# Altium project 机器人大赛硬件.PrjPcb (part 1 of 3)
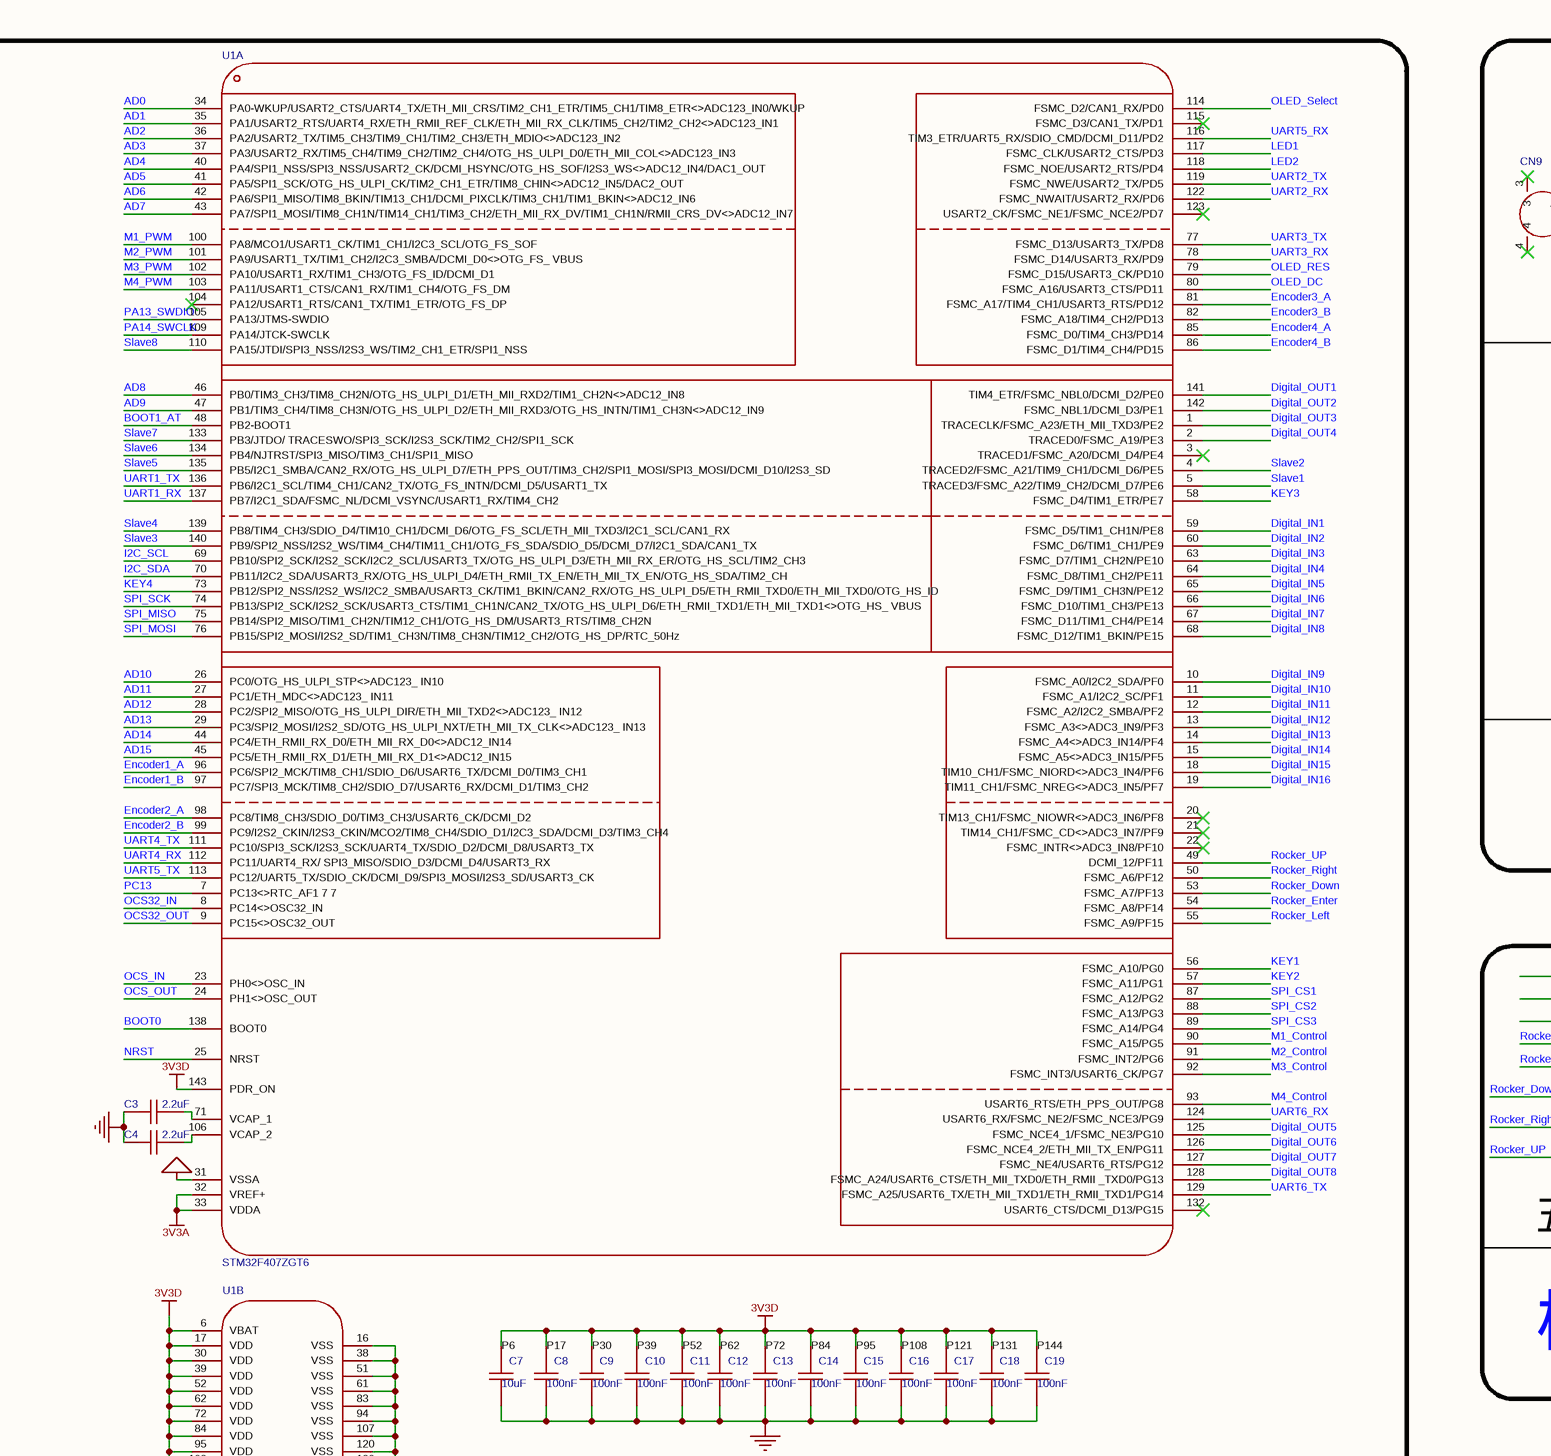
[diagram p0: P1.schdoc, top left]
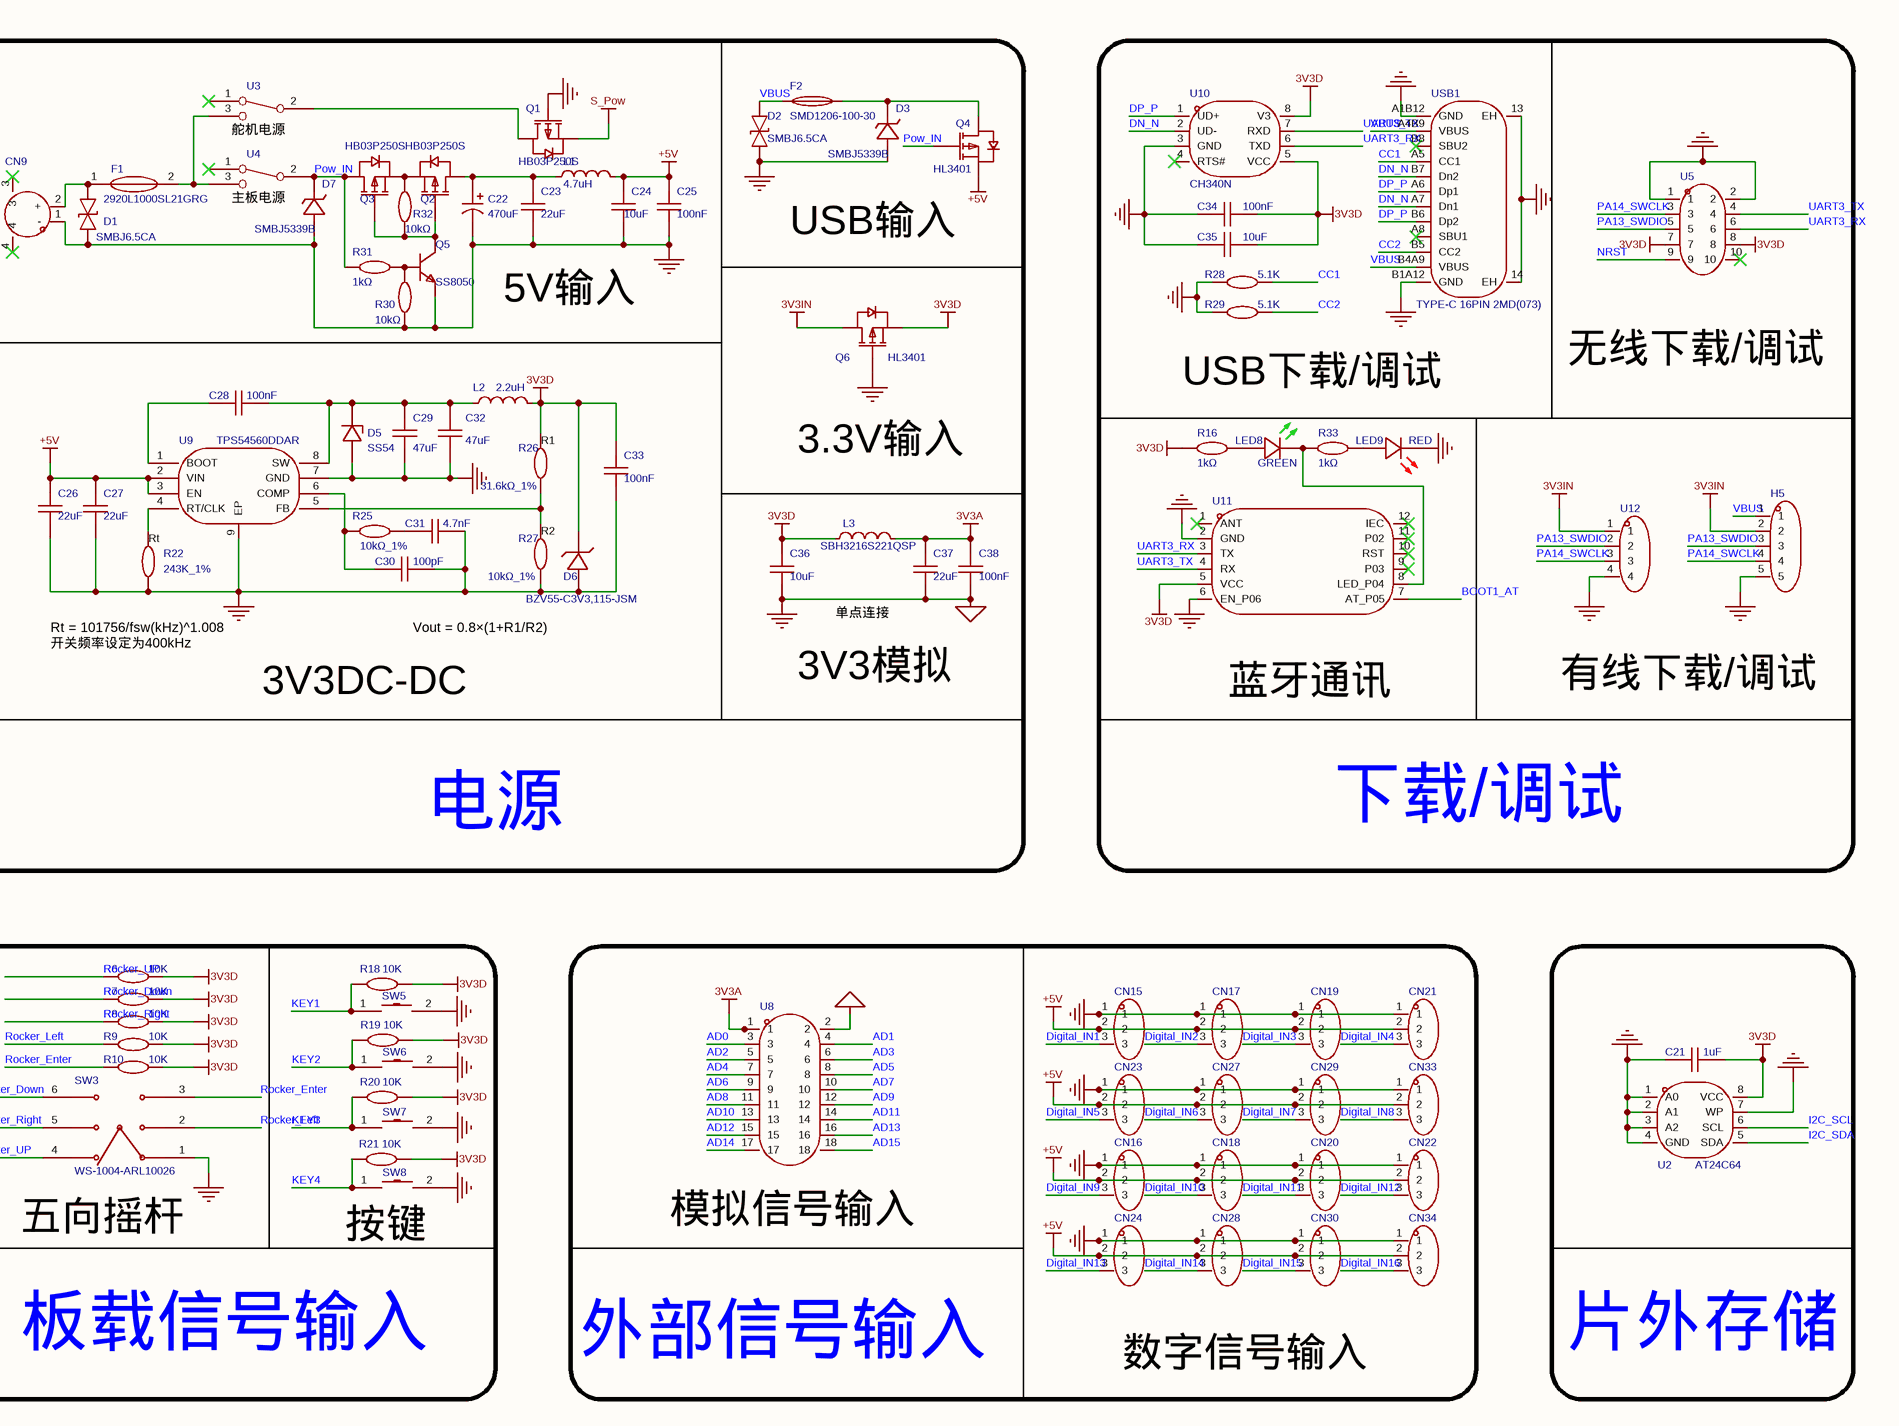
[diagram p1: P1.schdoc, top right]
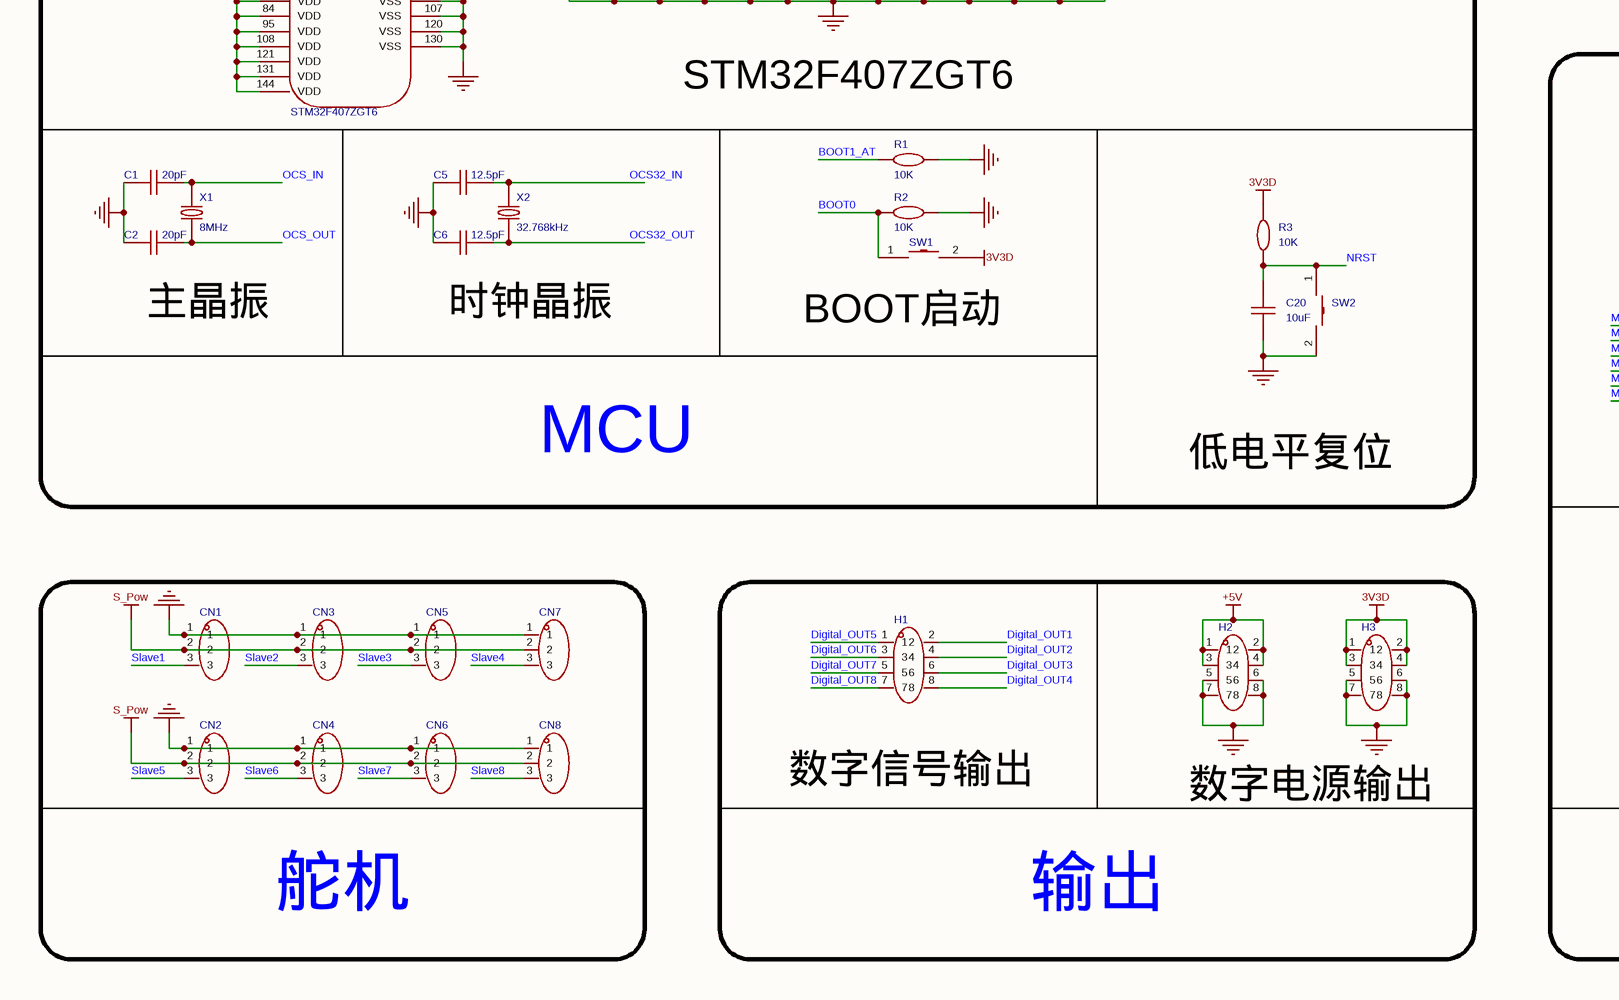
[diagram p2: P1.schdoc, bottom left]
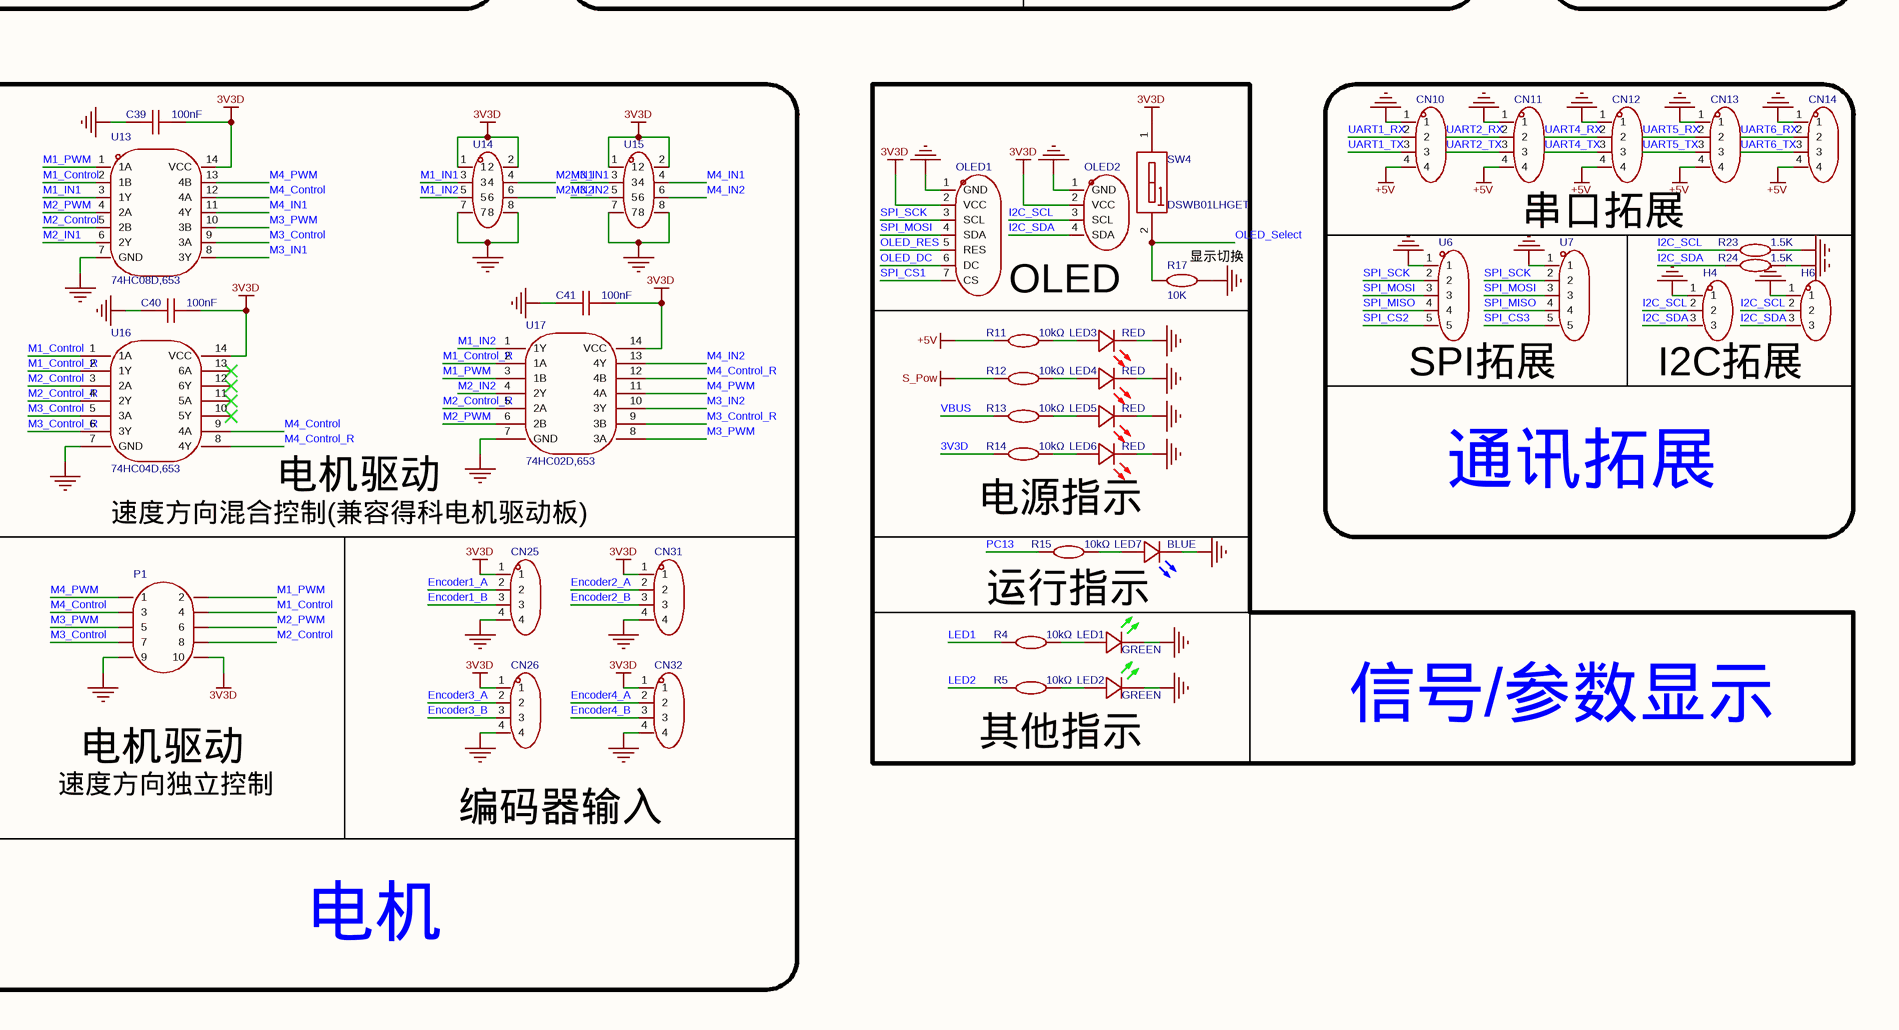
[diagram p3: P1.schdoc, bottom right]
1 sheet, 171 parts. Net scope: global (net labels, ports and power ports of the same name join across sheets).
Board file: PCB1.pcbdoc

## Sheet P1.schdoc
size 594 x 419 mm; Symbol: Sheet-Symbol_A2; Company: 开拓创新实验室; Drawed: Ideal_Fox; Version: V1.4; Page Size: A2; @Project Name: 机器人大赛硬件; @Page Count: 1; @Update Date: 2026-05-24; @Create Date: 2026-05-08; @Schematic Name: Schematic1; @Page No: 1; @Page Name: P1; Device: Sheet-Symbol_A2; Border: 1; Width: 2338; Height: 1652; Region Start: 1; X Region Count: 6; Y Region Count: 4; Blade Width: 10; Title Block Position: 3

### Parts
C1  20pF  [C0603]
C2  20pF  [C0603]
C3  2.2uF  [C0603]
C4  2.2uF  [C0603]
C5  12.5pF  [C0603]
C6  12.5pF  [C0603]
C7  10uF  [C0603]
C8  100nF  [C0603]
C9  100nF  [C0603]
C10  100nF  [C0603]
C11  100nF  [C0603]
C12  100nF  [C0603]
C13  100nF  [C0603]
C14  100nF  [C0603]
C15  100nF  [C0603]
C16  100nF  [C0603]
C17  100nF  [C0603]
C18  100nF  [C0603]
C19  100nF  [C0603]
C20  10uF  [C0603]
C21  1uF  [C0603]
C22  470uF  [CAP-SMD_BD6.3-L6.6-W6.6-LS7.3-FD-H7.7]
C23  22uF  [C0603]
C24  10uF  [C0603]
C25  100nF  [C0603]
C26  22uF  [C0603]
C27  22uF  [C0603]
C28  100nF  [C0603]
C29  47uF  [C0805]
C30  100pF  [C0603]
C31  4.7nF  [C0603]
C32  47uF  [C0805]
C33  100nF  [C0603]
C34  100nF  [C0603]
C35  10uF  [C0603]
C36  10uF  [C0603]
C37  22uF  [C0603]
C38  100nF  [C0603]
C39  100nF  [C0603]
C40  100nF  [C0603]
C41  100nF  [C0603]
CN1  ZX-XH2.54-3PZZ  [CONN-TH_3P-P2.54_2501S-3P]  (value not drawn)
CN2  ZX-XH2.54-3PZZ  [CONN-TH_3P-P2.54_2501S-3P]  (value not drawn)
CN3  ZX-XH2.54-3PZZ  [CONN-TH_3P-P2.54_2501S-3P]  (value not drawn)
CN4  ZX-XH2.54-3PZZ  [CONN-TH_3P-P2.54_2501S-3P]  (value not drawn)
CN5  ZX-XH2.54-3PZZ  [CONN-TH_3P-P2.54_2501S-3P]  (value not drawn)
CN6  ZX-XH2.54-3PZZ  [CONN-TH_3P-P2.54_2501S-3P]  (value not drawn)
CN7  ZX-XH2.54-3PZZ  [CONN-TH_3P-P2.54_2501S-3P]  (value not drawn)
CN8  ZX-XH2.54-3PZZ  [CONN-TH_3P-P2.54_2501S-3P]  (value not drawn)
CN9  XT60PW-M  [CONN-TH_XT60PW-M]  (value not drawn)
CN10  ZX-XH2.54-4PZZ  [CONN-TH_4P-P2.50_4PIN]  (value not drawn)
CN11  ZX-XH2.54-4PZZ  [CONN-TH_4P-P2.50_4PIN]  (value not drawn)
CN12  ZX-XH2.54-4PZZ  [CONN-TH_4P-P2.50_4PIN]  (value not drawn)
CN13  ZX-XH2.54-4PZZ  [CONN-TH_4P-P2.50_4PIN]  (value not drawn)
CN14  ZX-XH2.54-4PZZ  [CONN-TH_4P-P2.50_4PIN]  (value not drawn)
CN15  HX-XH2.54-3PZZ  [CONN-TH_3P-P2.50_HC-XH-3A-G]  (value not drawn)
CN16  HX-XH2.54-3PZZ  [CONN-TH_3P-P2.50_HC-XH-3A-G]  (value not drawn)
CN17  HX-XH2.54-3PZZ  [CONN-TH_3P-P2.50_HC-XH-3A-G]  (value not drawn)
CN18  HX-XH2.54-3PZZ  [CONN-TH_3P-P2.50_HC-XH-3A-G]  (value not drawn)
CN19  HX-XH2.54-3PZZ  [CONN-TH_3P-P2.50_HC-XH-3A-G]  (value not drawn)
CN20  HX-XH2.54-3PZZ  [CONN-TH_3P-P2.50_HC-XH-3A-G]  (value not drawn)
CN21  HX-XH2.54-3PZZ  [CONN-TH_3P-P2.50_HC-XH-3A-G]  (value not drawn)
CN22  HX-XH2.54-3PZZ  [CONN-TH_3P-P2.50_HC-XH-3A-G]  (value not drawn)
CN23  HX-XH2.54-3PZZ  [CONN-TH_3P-P2.50_HC-XH-3A-G]  (value not drawn)
CN24  HX-XH2.54-3PZZ  [CONN-TH_3P-P2.50_HC-XH-3A-G]  (value not drawn)
CN25  HX-XH2.54-4PZZ  [CONN-TH_4P-P2.50-XH2.54-4P]  (value not drawn)
CN26  HX-XH2.54-4PZZ  [CONN-TH_4P-P2.50-XH2.54-4P]  (value not drawn)
CN27  HX-XH2.54-3PZZ  [CONN-TH_3P-P2.50_HC-XH-3A-G]  (value not drawn)
CN28  HX-XH2.54-3PZZ  [CONN-TH_3P-P2.50_HC-XH-3A-G]  (value not drawn)
CN29  HX-XH2.54-3PZZ  [CONN-TH_3P-P2.50_HC-XH-3A-G]  (value not drawn)
CN30  HX-XH2.54-3PZZ  [CONN-TH_3P-P2.50_HC-XH-3A-G]  (value not drawn)
CN31  HX-XH2.54-4PZZ  [CONN-TH_4P-P2.50-XH2.54-4P]  (value not drawn)
CN32  HX-XH2.54-4PZZ  [CONN-TH_4P-P2.50-XH2.54-4P]  (value not drawn)
CN33  HX-XH2.54-3PZZ  [CONN-TH_3P-P2.50_HC-XH-3A-G]  (value not drawn)
CN34  HX-XH2.54-3PZZ  [CONN-TH_3P-P2.50_HC-XH-3A-G]  (value not drawn)
D1  SMBJ6.5CA  [SMB_L4.6-W3.5-LS5.3-BI]
D2  SMBJ6.5CA  [SMB_L4.6-W3.5-LS5.3-BI]
D3  SMBJ5339B  [SMB_L4.6-W3.6-LS5.4-RD]
D5  SS54  [SMA_L4.3-W2.6-LS5.0-FD]
D6  BZV55-C3V3,115-JSM  [SOD-80_L3.5-W1.5-RD]
D7  SMBJ5339B  [SMB_L4.6-W3.6-LS5.4-RD]
F1  2920L1000SL21GRG  [FUSE-SMD_L8.0-W5.5]
F2  SMD1206-100-30  [F1206]
H1  PZ254V-12-8P  [HDR-TH_8P-P2.54-V-M-R2-C4-S2.54]  (value not drawn)
H2  PZ254V-12-8P  [HDR-TH_8P-P2.54-V-M-R2-C4-S2.54]  (value not drawn)
H3  PZ254V-12-8P  [HDR-TH_8P-P2.54-V-M-R2-C4-S2.54]  (value not drawn)
H4  12251103CNG0S115001  [HDR-TH_3P-P2.54-V-M-1]  (value not drawn)
H5  PZ254-1-05-W-8.5  [HDR-TH_5P-P2.54-H-M-W10.4-N]  (value not drawn)
H6  12251103CNG0S115001  [HDR-TH_3P-P2.54-V-M-1]  (value not drawn)
L1  4.7uH  [IND-SMD_L4.6-W4.1-A]
L2  2.2uH  [IND-SMD_L4.6-W4.1_MHCI04015]
L3  SBH3216S221QSP  [L1206]
LED1  GREEN  [LED0805-FD_GL0805UG01]
LED2  GREEN  [LED0805-FD_GL0805UG01]
LED3  RED  [LED0805-R-RD_RED]
LED4  RED  [LED0805-R-RD_RED]
LED5  RED  [LED0805-R-RD_RED]
LED6  RED  [LED0805-R-RD_RED]
LED7  BLUE  [LED0805-RD_BLUE]
LED8  GREEN  [LED0805-FD_GL0805UG01]
LED9  RED  [LED0805-R-RD_RED]
OLED1  HS96L01W4S03  [OLED-TH_HS96L01W4S03]  (value not drawn)
OLED2  HS96L03W2C03  [OLED-TH_L27.8-W27.2-P2.54_C9900033791]  (value not drawn)
P1  2.54-2*5P简牛  [IDC-TH_10P-P2.54_C5665]  (value not drawn)
Q1  HB03P250S  [TO-252-2_L6.6-W6.1-P4.60-LS10.0-BR-CW]
Q2  HB03P250S  [TO-252-2_L6.6-W6.1-P4.60-LS10.0-BR-CW]
Q3  HB03P250S  [TO-252-2_L6.6-W6.1-P4.60-LS10.0-BR-CW]
Q4  HL3401  [SOT-23-3_L3.0-W1.7-P0.95-LS2.9-BR]
Q5  SS8050  [SOT-23-3_L2.9-W1.3-P1.90-LS2.4-BR]
Q6  HL3401  [SOT-23-3_L3.0-W1.7-P0.95-LS2.9-BR]
R1  10K  [R0603]
R2  10K  [R0603]
R3  10K  [R0603]
R4  10kΩ  [R0603]
R5  10kΩ  [R0603]
R6  10K  [R0603]
R7  10K  [R0603]
R8  10K  [R0603]
R9  10K  [R0603]
R10  10K  [R0603]
R11  10kΩ  [R0603]
R12  10kΩ  [R0603]
R13  10kΩ  [R0603]
R14  10kΩ  [R0603]
R15  10kΩ  [R0603]
R16  1kΩ  [R0603]
R17  10K  [R0603]
R18  10K  [R0603]
R19  10K  [R0603]
R20  10K  [R0603]
R21  10K  [R0603]
R22  243K_1%  [R0603]
R23  1.5K  [R0603]
R24  1.5K  [R0603]
R25  10kΩ_1%  [R0603]
R26  31.6kΩ_1%  [R0603]
R27  10kΩ_1%  [R0603]
R28  5.1K  [R0603]
R29  5.1K  [R0603]
R30  10kΩ  [R0603]
R31  1kΩ  [R0603]
R32  10kΩ  [R0603]
R33  1kΩ  [R0603]
SW1  TS-1101-C-W  [SW-SMD_L6.0-W3.3-LS8.0_TS-1101-C-W]  (value not drawn)
SW2  TS-1101-C-W  [SW-SMD_L6.0-W3.3-LS8.0_TS-1101-C-W]  (value not drawn)
SW3  WS-1004-ARL10026  [SW-TH_WS-1004-ARL10026]
SW4  DSWB01LHGET  [SW-TH_DSWB01LHGET]
SW5  TS-1101-C-W  [SW-SMD_L6.0-W3.3-LS8.0_TS-1101-C-W]  (value not drawn)
SW6  TS-1101-C-W  [SW-SMD_L6.0-W3.3-LS8.0_TS-1101-C-W]  (value not drawn)
SW7  TS-1101-C-W  [SW-SMD_L6.0-W3.3-LS8.0_TS-1101-C-W]  (value not drawn)
SW8  TS-1101-C-W  [SW-SMD_L6.0-W3.3-LS8.0_TS-1101-C-W]  (value not drawn)
U1  STM32F407ZGT6  [LQFP-144_L20.0-W20.0-P0.50-LS22.0-BL]  (parts A,B of 2)
U2  AT24C64  [SOP-8_L4.9-W3.9-P1.27-LS6.0-BL]
U3  MT-0-102-A101-M200-RS  [SW-TH_MT-0-103-A101-M200-RS]  (value not drawn)
U4  MT-0-102-A101-M200-RS  [SW-TH_MT-0-103-A101-M200-RS]  (value not drawn)
U5  2.54-2*5  [HDR-TH_10P-P2.54-V-F-R2-C5-S2.54]  (value not drawn)
U6  MTP125-1105S1  [HDR-TH_5P-P2.54-V-M]  (value not drawn)
U7  MTP125-1105S1  [HDR-TH_5P-P2.54-V-M]  (value not drawn)
U8  XDFH-0254-2*9P  [CONN-TH_18P-P2.54_LX_XDFH-0254-2X9P]  (value not drawn)
U9  TPS54560DDAR  [SOIC-8_L5.0-W4.0-P1.27-LS6.0-BL-EP2.0]
U10  CH340N  [SOP-8_L4.9-W3.9-P1.27-LS6.0-BL]
U11  (no value)  [BULETM-SMD_RF-BM-4044B2]
U12  B4B-XH-A(LF)(SN)  [CONN-TH_B4B-XH-A-LF-SN]  (value not drawn)
U13  74HC08D,653  [SOIC-14_L8.7-W3.9-P1.27-LS6.0-BL]
U14  XDFH-0254-2*4P  [CONN-TH_8P-P2.54_LX_XDFH-0254-2X4P]  (value not drawn)
U15  XDFH-0254-2*4P  [CONN-TH_8P-P2.54_LX_XDFH-0254-2X4P]  (value not drawn)
U16  74HC04D,653  [SOIC-14_L8.7-W3.9-P1.27-LS6.0-BL]
U17  74HC02D,653  [SOIC-14_L8.7-W3.9-P1.27-LS6.0-BL]
USB1  TYPE-C 16PIN 2MD(073)  [USB-C-SMD_TYPE-C-16PIN-2MD-073]
X1  8MHz  [CRYSTAL-TH_L11.1-W4.7-P4.88]
X2  32.768kHz  [FC-135R_L3.2-W1.5]

### Blocks framed on the sheet
MCU: C1-C20 R1-R3 SW1 SW2 U1 X1 X2
电源: C22-C33 C36-C38 CN9 D1-D3 D5-D7 F1 F2 L1-L3 Q1-Q6 R22 R25-R27 R30-R32 U3 U4 U9
下载/调试: C34 C35 H5 LED8 LED9 R16 R28 R29 R33 U5 U10-U12 USB1
板载信号输入: R6-R10 R18-R21 SW3 SW5-SW8
外部信号输入: CN15-CN24 CN27-CN30 CN33 CN34 U8
片外存储: C21 U2
电机: C39-C41 CN25 CN26 CN31 CN32 P1 U13-U17
信号/参数显示: LED1-LED7 OLED1 OLED2 R4 R5 R11-R15 R17 SW4
通讯拓展: CN10-CN14 H4 H6 R23 R24 U6 U7
舵机: CN1-CN8
输出: H1-H3

### Nets
3V3A: C37.2 C38.2 L3.2 U1.32(VREF+) U1.33(VDDA) U8.1
3V3D: C7.2 C8.2 C9.2 C10.2 C11.2 C12.2 C13.2 C14.2 C15.2 C16.2 C17.2 C18.2 C19.2 C21.1 C33.2 C34.1 C35.1 C36.2 C39.1 C40.1 C41.1 CN25.1 CN26.1 CN31.1 CN32.1 D6.1(K) H3.1 H3.2 H3.3 H3.4 L2.2 L3.1 OLED1.2(VCC) OLED2.2(VCC) P1.10 Q6.2(S) R3.2 R6.2 R7.2 R8.2 R9.2 R10.2 R14.2 R16.2 R18.2 R19.2 R20.2 R21.2 R26.2 SW1.2 SW4.1(A1) U1.6(VBAT) U1.17(VDD) U1.30(VDD) U1.39(VDD) U1.52(VDD) U1.62(VDD) U1.72(VDD) U1.84(VDD) U1.95(VDD) U1.108(VDD) U1.121(VDD) U1.131(VDD) U1.143(PDR_ON) U1.144(VDD) U2.8(VCC) U5.7 U5.8 U10.5(VCC) U10.8(V3) U11.5(VCC) U13.14(VCC) U14.1 U14.2 U15.1 U15.2 U16.14(VCC) U17.14(VCC)
3V3IN: H5.2 Q6.3(D) U12.1
+5V: C24.2 C25.2 C26.2 C27.2 CN10.4 CN11.4 CN12.4 CN13.4 CN14.4 CN15.2 CN16.2 CN17.2 CN18.2 CN19.2 CN20.2 CN21.2 CN22.2 CN23.2 CN24.2 CN27.2 CN28.2 CN29.2 CN30.2 CN33.2 CN34.2 H2.1 H2.2 H2.3 H2.4 L1.2 Q4.2(S) R11.2 U9.2(VIN) U9.3(EN)
AGND: C1.1 C2.1 C3.2 C4.2 C5.1 C6.1 C7.1 C8.1 C9.1 C10.1 C11.1 C12.1 C13.1 C14.1 C15.1 C16.1 C17.1 C18.1 C19.1 C20.1 C21.2 C22.2 C23.1 C24.1 C25.1 C26.1 C27.1 C29.1 C30.1 C31.1 C32.1 C33.1 C34.2 C35.2 C36.1 C37.1 C38.1 C39.2 C40.2 C41.2 CN1.1 CN2.1 CN3.1 CN4.1 CN5.1 CN6.1 CN7.1 CN8.1 CN9.1(-) CN10.1 CN11.1 CN12.1 CN13.1 CN14.1 CN15.1 CN16.1 CN17.1 CN18.1 CN19.1 CN20.1 CN21.1 CN22.1 CN23.1 CN24.1 CN25.4 CN26.4 CN27.1 CN28.1 CN29.1 CN30.1 CN31.4 CN32.4 CN33.1 CN34.1 D1.2 D2.2 D3.2(A) D5.1(A) D6.2(A) D7.2(A) H2.5 H2.6 H2.7 H2.8 H3.5 H3.6 H3.7 H3.8 H4.1 H5.5 H6.1 LED1.2(C) LED2.2(C) LED3.2(C) LED4.2(C) LED5.2(C) LED6.2(C) LED7.1(K) LED9.2(C) OLED1.1(GND) OLED2.1(GND) P1.9 Q1.1(G) Q5.2(E) Q6.1(G) R1.2 R2.2 R17.1 R22.2 R23.2 R24.2 R27.1 R28.2 R29.2 R30.1 SW2.2 SW3.1 SW5.2 SW6.2 SW7.2 SW8.2 U1.16(VSS) U1.31(VSSA) U1.38(VSS) U1.51(VSS) U1.61(VSS) U1.83(VSS) U1.94(VSS) U1.107(VSS) U1.120(VSS) U1.130(VSS) U2.1(A0) U2.2(A1) U2.3(A2) U2.4(GND) U2.7(WP) U5.1 U5.2 U6.1 U7.1 U8.2 U9.7(GND) U9.9(EP) U10.3(GND) U11.2(GND) U11.6(EN_P06) U12.4 U13.7(GND) U14.7 U14.8 U15.7 U15.8 U16.7(GND) U17.7(GND) USB1.13(EH) USB1.14(EH) USB1.A1B12(GND) USB1.B1A12(GND)  [also labelled GND]
S_Pow: CN1.2 CN2.2 CN3.2 CN4.2 CN5.2 CN6.2 CN7.2 CN8.2 Q1.3(S) R12.2
AD0: U1.34(PA0-WKUP/USART2_CTS/UART4_TX/ETH_MII_CRS/TIM2_CH1_ETR/TIM5_CH1/TIM8_ETR<>ADC123_IN0/WKUP) U8.3
AD1: U1.35(PA1/USART2_RTS/UART4_RX/ETH_RMII_REF_CLK/ETH_MII_RX_CLK/TIM5_CH2/TIM2_CH2<>ADC123_IN1) U8.4
AD2: U1.36(PA2/USART2_TX/TIM5_CH3/TIM9_CH1/TIM2_CH3/ETH_MDIO<>ADC123_IN2) U8.5
AD3: U1.37(PA3/USART2_RX/TIM5_CH4/TIM9_CH2/TIM2_CH4/OTG_HS_ULPI_D0/ETH_MII_COL<>ADC123_IN3) U8.6
AD4: U1.40(PA4/SPI1_NSS/SPI3_NSS/USART2_CK/DCMI_HSYNC/OTG_HS_SOF/I2S3_WS<>ADC12_IN4/DAC1_OUT) U8.7
AD5: U1.41(PA5/SPI1_SCK/OTG_HS_ULPI_CK/TIM2_CH1_ETR/TIM8_CHIN<>ADC12_IN5/DAC2_OUT) U8.8
AD6: U1.42(PA6/SPI1_MISO/TIM8_BKIN/TIM13_CH1/DCMI_PIXCLK/TIM3_CH1/TIM1_BKIN<>ADC12_IN6) U8.9
AD7: U1.43(PA7/SPI1_MOSI/TIM8_CH1N/TIM14_CH1/TIM3_CH2/ETH_MII_RX_DV/TIM1_CH1N/RMII_CRS_DV<>ADC12_IN7) U8.10
AD8: U1.46(PB0/TIM3_CH3/TIM8_CH2N/OTG_HS_ULPI_D1/ETH_MII_RXD2/TIM1_CH2N<>ADC12_IN8) U8.11
AD9: U1.47(PB1/TIM3_CH4/TIM8_CH3N/OTG_HS_ULPI_D2/ETH_MII_RXD3/OTG_HS_INTN/TIM1_CH3N<>ADC12_IN9) U8.12
AD10: U1.26(PC0/OTG_HS_ULPI_STP<>ADC123__IN10) U8.13
AD11: U1.27(PC1/ETH_MDC<>ADC123__IN11) U8.14
AD12: U1.28(PC2/SPI2_MISO/OTG_HS_ULPI_DIR/ETH_MII_TXD2<>ADC123__IN12) U8.15
AD13: U1.29(PC3/SPI2_MOSI/I2S2_SD/OTG_HS_ULPI_NXT/ETH_MII_TX_CLK<>ADC123__IN13) U8.16
AD14: U1.44(PC4/ETH_RMII_RX_D0/ETH_MII_RX_D0<>ADC12_IN14) U8.17
AD15: U1.45(PC5/ETH_RMII_RX_D1/ETH_MII_RX_D1<>ADC12_IN15) U8.18
BOOT0: R2.1 SW1.1 U1.138(BOOT0)
BOOT1_AT: R1.1 U1.48(PB2-BOOT1) U11.7(AT_P05)
CC1: R28.1 USB1.A5(CC1)
CC2: R29.1 USB1.B5(CC2)
Digital_IN1: CN15.3 U1.59(FSMC_D5/TIM1_CH1N/PE8)
Digital_IN2: CN17.3 U1.60(FSMC_D6/TIM1_CH1/PE9)
Digital_IN3: CN19.3 U1.63(FSMC_D7/TIM1_CH2N/PE10)
Digital_IN4: CN21.3 U1.64(FSMC_D8/TIM1_CH2/PE11)
Digital_IN5: CN23.3 U1.65(FSMC_D9/TIM1_CH3N/PE12)
Digital_IN6: CN27.3 U1.66(FSMC_D10/TIM1_CH3/PE13)
Digital_IN7: CN29.3 U1.67(FSMC_D11/TIM1_CH4/PE14)
Digital_IN8: CN33.3 U1.68(FSMC_D12/TIM1_BKIN/PE15)
Digital_IN9: CN16.3 U1.10(FSMC_A0/I2C2_SDA/PF0)
Digital_IN10: CN18.3 U1.11(FSMC_A1/I2C2_SC/PF1)
Digital_IN11: CN20.3 U1.12(FSMC_A2/I2C2_SMBA/PF2)
Digital_IN12: CN22.3 U1.13(FSMC_A3<>ADC3_IN9/PF3)
Digital_IN13: CN24.3 U1.14(FSMC_A4<>ADC3_IN14/PF4)
Digital_IN14: CN28.3 U1.15(FSMC_A5<>ADC3_IN15/PF5)
Digital_IN15: CN30.3 U1.18(TIM10_CH1/FSMC_NIORD<>ADC3_IN4/PF6)
Digital_IN16: CN34.3 U1.19(TIM11_CH1/FSMC_NREG<>ADC3_IN5/PF7)
Digital_OUT1: H1.2 U1.141(TIM4_ETR/FSMC_NBL0/DCMI_D2/PE0)
Digital_OUT2: H1.4 U1.142(FSMC_NBL1/DCMI_D3/PE1)
Digital_OUT3: H1.6 U1.1(TRACECLK/FSMC_A23/ETH_MII_TXD3/PE2)
Digital_OUT4: H1.8 U1.2(TRACED0/FSMC_A19/PE3)
Digital_OUT5: H1.1 U1.125(FSMC_NCE4_1/FSMC_NE3/PG10)
Digital_OUT6: H1.3 U1.126(FSMC_NCE4_2/ETH_MII_TX_EN/PG11)
Digital_OUT7: H1.5 U1.127(FSMC_NE4/USART6_RTS/PG12)
Digital_OUT8: H1.7 U1.128(FSMC_A24/USART6_CTS/ETH_MII_TXD0/ETH_RMII__TXD0/PG13)
DN_N: U10.2(UD-) USB1.A7(Dn1) USB1.B7(Dn2)
DP_P: U10.1(UD+) USB1.A6(Dp1) USB1.B6(Dp2)
Encoder1_A: CN25.2 U1.96(PC6/SPI2_MCK/TIM8_CH1/SDIO_D6/USART6_TX/DCMI_D0/TIM3_CH1)
Encoder1_B: CN25.3 U1.97(PC7/SPI3_MCK/TIM8_CH2/SDIO_D7/USART6_RX/DCMI_D1/TIM3_CH2)
Encoder2_A: CN31.2 U1.98(PC8/TIM8_CH3/SDIO_D0/TIM3_CH3/USART6_CK/DCMI_D2)
Encoder2_B: CN31.3 U1.99(PC9/I2S2_CKIN/I2S3_CKIN/MCO2/TIM8_CH4/SDIO_D1/I2C3_SDA/DCMI_D3/TIM3_CH4)
Encoder3_A: CN26.2 U1.81(FSMC_A17/TIM4_CH1/USART3_RTS/PD12)
Encoder3_B: CN26.3 U1.82(FSMC_A18/TIM4_CH2/PD13)
Encoder4_A: CN32.2 U1.85(FSMC_D0/TIM4_CH3/PD14)
Encoder4_B: CN32.3 U1.86(FSMC_D1/TIM4_CH4/PD15)
I2C_SCL: H4.2 H6.2 OLED2.3(SCL) R23.1 U1.69(PB10/SPI2_SCK/I2S2_SCK/I2C2_SCL/USART3_TX/OTG_HS_ULPI_D3/ETH_MII_RX_ER/OTG_HS_SCL/TIM2_CH3) U2.6(SCL)
I2C_SDA: H4.3 H6.3 OLED2.4(SDA) R24.1 U1.70(PB11/I2C2_SDA/USART3_RX/OTG_HS_ULPI_D4/ETH_RMII_TX_EN/ETH_MII_TX_EN/OTG_HS_SDA/TIM2_CH) U2.5(SDA)
KEY1: R18.1 SW5.1 U1.56(FSMC_A10/PG0)
KEY2: R19.1 SW6.1 U1.57(FSMC_A11/PG1)
KEY3: R20.1 SW7.1 U1.58(FSMC_D4/TIM1_ETR/PE7)
KEY4: R21.1 SW8.1 U1.73(PB12/SPI2_NSS/I2S2_WS/I2C2_SMBA/USART3_CK/TIM1_BKIN/CAN2_RX/OTG_HS_ULPI_D5/ETH_RMII_TXD0/ETH_MII_TXD0/OTG_HS_ID)
LED1: R4.2 U1.117(FSMC_CLK/USART2_CTS/PD3)
LED2: R5.2 U1.118(FSMC_NOE/USART2_RTS/PD4)
M1_Control: P1.4 U1.90(FSMC_A15/PG5) U13.2(1B) U16.1(1A)
M1_Control_R: U16.2(1Y) U17.2(1A)
M1_IN1: U13.3(1Y) U14.3
M1_IN2: U14.5 U17.1(1Y)
M1_PWM: P1.2 U1.100(PA8/MCO1/USART1_CK/TIM1_CH1/I2C3_SCL/OTG_FS_SOF) U13.1(1A) U17.3(1B)
M2_Control: P1.8 U1.91(FSMC_INT2/PG6) U13.5(2B) U16.3(2A)
M2_Control_R: U16.4(2Y) U17.5(2A)
M2_IN1: U13.6(2Y) U14.4
M2_IN2: U14.6 U17.4(2Y)
M2_PWM: P1.6 U1.101(PA9/USART1_TX/TIM1_CH2/I2C3_SMBA/DCMI_D0<>OTG_FS__VBUS) U13.4(2A) U17.6(2B)
M3_Control: P1.7 U1.92(FSMC_INT3/USART6_CK/PG7) U13.9(3A) U16.5(3A)
M3_Control_R: U16.6(3Y) U17.9(3B)
M3_IN1: U13.8(3Y) U15.3
M3_IN2: U15.5 U17.10(3Y)
M3_PWM: P1.5 U1.102(PA10/USART1_RX/TIM1_CH3/OTG_FS_ID/DCMI_D1) U13.10(3B) U17.8(3A)
M4_Control: P1.3 U1.93(USART6_RTS/ETH_PPS_OUT/PG8) U13.12(4A) U16.9(4A)
M4_Control_R: U16.8(4Y) U17.12(4B)
M4_IN1: U13.11(4Y) U15.4
M4_IN2: U15.6 U17.13(4Y)
M4_PWM: P1.1 U1.103(PA11/USART1_CTS/CAN1_RX/TIM1_CH4/OTG_FS_DM) U13.13(4B) U17.11(4A)
NRST: C20.2 R3.1 SW2.1 U1.25(NRST) U5.9
OCS32_IN: C5.2 U1.8(PC14<>OSC32_IN) X2.2
OCS32_OUT: C6.2 U1.9(PC15<>OSC32_OUT) X2.1
OCS_IN: C1.2 U1.23(PH0<>OSC_IN) X1.2
OCS_OUT: C2.2 U1.24(PH1<>OSC_OUT) X1.1
OLED_DC: OLED1.6(DC) U1.80(FSMC_A16/USART3_CTS/PD11)
OLED_RES: OLED1.5(RES) U1.79(FSMC_D15/USART3_CK/PD10)
OLED_Select: R17.2 SW4.2 U1.114(FSMC_D2/CAN1_RX/PD0)
PA13_SWDIO: H5.3 U1.105(PA13/JTMS-SWDIO) U5.5 U12.2
PA14_SWCLK: H5.4 U1.109(PA14/JTCK-SWCLK) U5.3 U12.3
PC13: R15.2 U1.7(PC13<>RTC_AF1_7_7)
Pow_IN: D7.1(K) Q3.2(D) Q4.1(G) R31.2 U4.2
Rocker_Down: R7.1 SW3.6 U1.53(FSMC_A7/PF13)
Rocker_Enter: R10.1 SW3.3 U1.54(FSMC_A8/PF14)
Rocker_Left: R9.1 SW3.2 U1.55(FSMC_A9/PF15)
Rocker_Right: R8.1 SW3.5 U1.50(FSMC_A6/PF12)
Rocker_UP: R6.1 SW3.4 U1.49(DCMI_12/PF11)
Slave1: CN1.3 U1.5(TRACED3/FSMC_A22/TIM9_CH2/DCMI_D7/PE6)
Slave2: CN3.3 U1.4(TRACED2/FSMC_A21/TIM9_CH1/DCMI_D6/PE5)
Slave3: CN5.3 U1.140(PB9/SPI2_NSS/I2S2_WS/TIM4_CH4/TIM11_CH1/OTG_FS_SDA/SDIO_D5/DCMI_D7/I2C1_SDA/CAN1_TX)
Slave4: CN7.3 U1.139(PB8/TIM4_CH3/SDIO_D4/TIM10_CH1/DCMI_D6/OTG_FS_SCL/ETH_MII_TXD3/I2C1_SCL/CAN1_RX)
Slave5: CN2.3 U1.135(PB5/I2C1_SMBA/CAN2_RX/OTG_HS_ULPI_D7/ETH_PPS_OUT/TIM3_CH2/SPI1_MOSI/SPI3_MOSI/DCMI_D10/I2S3_SD)
Slave6: CN4.3 U1.134(PB4/NJTRST/SPI3_MISO/TIM3_CH1/SPI1_MISO)
Slave7: CN6.3 U1.133(PB3/JTDO/_TRACESWO/SPI3_SCK/I2S3_SCK/TIM2_CH2/SPI1_SCK)
Slave8: CN8.3 U1.110(PA15/JTDI/SPI3_NSS/I2S3_WS/TIM2_CH1_ETR/SPI1_NSS)
SPI_CS1: OLED1.7(CS) U1.87(FSMC_A12/PG2)
SPI_CS2: U1.88(FSMC_A13/PG3) U6.5
SPI_CS3: U1.89(FSMC_A14/PG4) U7.5
SPI_MISO: U1.75(PB14/SPI2_MISO/TIM1_CH2N/TIM12_CH1/OTG_HS_DM/USART3_RTS/TIM8_CH2N) U6.4 U7.4
SPI_MOSI: OLED1.4(SDA) U1.76(PB15/SPI2_MOSI/I2S2_SD/TIM1_CH3N/TIM8_CH3N/TIM12_CH2/OTG_HS_DP/RTC_50Hz) U6.3 U7.3
SPI_SCK: OLED1.3(SCL) U1.74(PB13/SPI2_SCK/I2S2_SCK/USART3_CTS/TIM1_CH1N/CAN2_TX/OTG_HS_ULPI_D6/ETH_RMII_TXD1/ETH_MII_TXD1<>OTG_HS__VBUS) U6.2 U7.2
UART1_RX: CN10.2 U1.137(PB7/I2C1_SDA/FSMC_NL/DCMI_VSYNC/USART1_RX/TIM4_CH2)
UART1_TX: CN10.3 U1.136(PB6/I2C1_SCL/TIM4_CH1/CAN2_TX/OTG_FS_INTN/DCMI_D5/USART1_TX)
UART2_RX: CN11.2 U1.122(FSMC_NWAIT/USART2_RX/PD6)
UART2_TX: CN11.3 U1.119(FSMC_NWE/USART2_TX/PD5)
UART3_RX: U1.78(FSMC_D14/USART3_RX/PD9) U5.6 U10.6(TXD) U11.3(TX)
UART3_TX: U1.77(FSMC_D13/USART3_TX/PD8) U5.4 U10.7(RXD) U11.4(RX)
UART4_RX: CN12.2 U1.112(PC11/UART4_RX/_SPI3_MISO/SDIO_D3/DCMI_D4/USART3_RX)
UART4_TX: CN12.3 U1.111(PC10/SPI3_SCK/I2S3_SCK/UART4_TX/SDIO_D2/DCMI_D8/USART3_TX)
UART5_RX: CN13.2 U1.116(TIM3_ETR/UART5_RX/SDIO_CMD/DCMI_D11/PD2)
UART5_TX: CN13.3 U1.113(PC12/UART5_TX/SDIO_CK/DCMI_D9/SPI3_MOSI/I2S3_SD/USART3_CK)
UART6_RX: CN14.2 U1.124(USART6_RX/FSMC_NE2/FSMC_NCE3/PG9)
UART6_TX: CN14.3 U1.129(FSMC_A25/USART6_TX/ETH_MII_TXD1/ETH_RMII_TXD1/PG14)
VBUS: D2.1 F2.1 H5.1 R13.2 USB1.A4B9(VBUS) USB1.B4A9(VBUS)
NetC3_1: C3.1 U1.71(VCAP_1)
NetC4_1: C4.1 U1.106(VCAP_2)
NetC22_1: C22.1 C23.2 L1.1 Q2.2(D)
NetC28_1: C28.1 C29.2 C32.2 D5.2(K) L2.1 U9.8(SW)
NetC28_2: C28.2 U9.1(BOOT)
NetC30_2: C30.2 R25.2 U9.6(COMP)
NetC31_2: C31.2 R25.1
NetCN9_2: CN9.2(+) D1.1 F1.1
NetD3_1: D3.1(K) F2.2 Q4.3(D)
NetF1_2: F1.2 U3.3 U4.3
NetLED1_1: LED1.1(A) R4.1
NetLED2_1: LED2.1(A) R5.1
NetLED3_1: LED3.1(A) R11.1
NetLED4_1: LED4.1(A) R12.1
NetLED5_1: LED5.1(A) R13.1
NetLED6_1: LED6.1(A) R14.1
NetLED7_2: LED7.2(A) R15.1
NetLED8_1: LED8.1(A) R16.1
NetLED8_2: LED8.2(C) R33.2 U11.8(LED_P04)
NetLED9_1: LED9.1(A) R33.1
NetQ1_2: Q1.2(D) U3.2
NetQ2_1: Q2.1(G) Q3.1(G) Q5.3(C) R32.1
NetQ2_3: Q2.3(S) Q3.3(S) R32.2
NetQ5_1: Q5.1(B) R30.2 R31.1
NetR22_1: R22.1 U9.4(RT/CLK)
NetR26_1: R26.1 R27.2 U9.5(FB)

Not connected (* = marked no-connect by the designer): CN9 3* 4*; U1 3(TRACED1/FSMC_A20/DCMI_D4/PE4)* 20(TIM13_CH1/FSMC_NIOWR<>ADC3_IN6/PF8)* 21(TIM14_CH1/FSMC_CD<>ADC3_IN7/PF9)* 22(FSMC_INTR<>ADC3_IN8/PF10)* 104(PA12/USART1_RTS/CAN1_TX/TIM1_ETR/OTG_FS_DP)* 115(FSMC_D3/CAN1_TX/PD1)* 123(USART2_CK/FSMC_NE1/FSMC_NCE2/PD7)* 132(USART6_CTS/DCMI_D13/PG15)*; U3 1*; U4 1*; U5 10*; U10 4(RTS#)*; U11 1(ANT)* 9(P03)* 10(RST)* 11(P02)* 12(IEC)*; U16 10(5Y)* 11(5A)* 12(6Y)* 13(6A)*; USB1 A8(SBU1)* B8(SBU2)*

### Notes on the sheet
- (near U3) 舵机电源
- (near U4) 主板电源
- USB输入
- 5V输入
- 无线下载/调试
- (near R26) R1
- USB下载/调试
- 3.3V输入
- (near R22) Rt
- (near R27) R2
- (near R22) Rt = 101756/fsw(kHz)^1.008
- 开关频率设定为400kHz
- Vout = 0.8×(1+R1/R2)
- 单点连接
- 3V3DC-DC
- 3V3模拟
- 蓝牙通讯
- 有线下载/调试
- (near SW3) 五向摇杆
- (near SW8) 按键
- (near U8) 模拟信号输入
- (near C7) P6
- (near C8) P17
- (near C9) P30
- (near C10) P39
- (near C11) P52
- (near C12) P62
- (near C13) P72
- (near C14) P84
- (near C15) P95
- (near C16) P108
- (near C17) P121
- (near C18) P131
- (near C19) P144
- 数字信号输入
- STM32F407ZGT6
- (near R17) 显示切换
- 串口拓展
- OLED
- 主晶振
- 时钟晶振
- (near SW1) BOOT启动
- (near U6) SPI拓展
- (near H4) I2C拓展
- 电机驱动
- 低电平复位
- 速度方向混合控制(兼容得科电机驱动板)
- 电源指示
- (near R15) 运行指示
- 速度方向独立控制
- (near R5) 其他指示
- 数字信号输出
- 数字电源输出
- (near CN26) 编码器输入
- 更新日期
- 2026-05-24
- 原理图
- 图页
- Schematic1
- P1
- 创建日期
- 物料编码
- 2026-05-08
- 审阅
- 绘制
- Ideal_Fox
- 机器人大赛硬件
- 版本
- V1.4
- 尺寸
- A2
- 页
- 1
- 开拓创新实验室
- 共